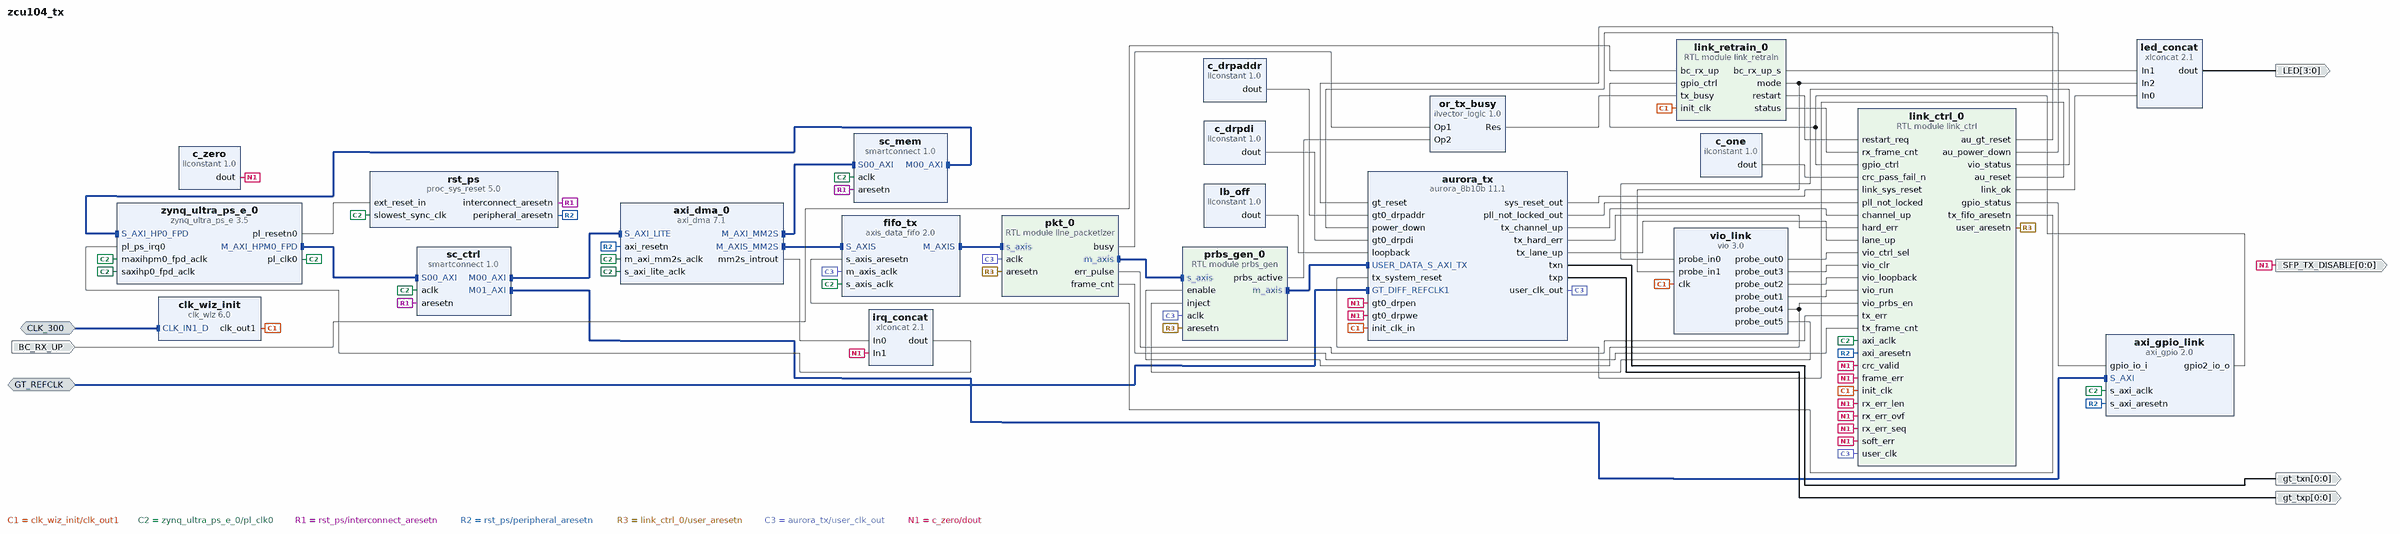
[diagram p0: block diagram of the top level]
# Vivado block design zcu104_tx, xczu7ev-ffvc1156-2-e, Vivado 2025.2
create_bd_design zcu104_tx

create_bd_intf_port -mode Slave -vlnv xilinx.com:interface:diff_clock_rtl:1.0 CLK_300
set_property -dict {CONFIG.FREQ_HZ 300000000} [get_bd_intf_ports CLK_300]
create_bd_intf_port -mode Slave -vlnv xilinx.com:interface:diff_clock_rtl:1.0 GT_REFCLK
set_property -dict {CONFIG.FREQ_HZ 125000000} [get_bd_intf_ports GT_REFCLK]
create_bd_port -dir O -from 0 -to 0 gt_txp
create_bd_port -dir O -from 0 -to 0 gt_txn
create_bd_port -dir O -from 0 -to 0 SFP_TX_DISABLE
create_bd_port -dir O -from 3 -to 0 LED
create_bd_port -dir I BC_RX_UP

create_bd_cell -type ip -vlnv xilinx.com:ip:zynq_ultra_ps_e:3.5 zynq_ultra_ps_e_0
set_property -dict [list \
  CONFIG.PSU_BANK_0_IO_STANDARD LVCMOS18 \
  CONFIG.PSU_BANK_1_IO_STANDARD LVCMOS18 \
  CONFIG.PSU_BANK_2_IO_STANDARD LVCMOS18 \
  CONFIG.PSU_USB3__DUAL_CLOCK_ENABLE 1 \
  CONFIG.PSU__CAN1__PERIPHERAL__ENABLE 1 \
  CONFIG.PSU__CAN1__PERIPHERAL__IO {MIO 24 .. 25} \
  CONFIG.PSU__CRF_APB__ACPU_CTRL__FREQMHZ 1200 \
  CONFIG.PSU__CRF_APB__ACPU_CTRL__SRCSEL APLL \
  CONFIG.PSU__CRF_APB__APLL_CTRL__SRCSEL PSS_REF_CLK \
  CONFIG.PSU__CRF_APB__DBG_FPD_CTRL__FREQMHZ 250 \
  CONFIG.PSU__CRF_APB__DBG_FPD_CTRL__SRCSEL IOPLL \
  CONFIG.PSU__CRF_APB__DBG_TRACE_CTRL__FREQMHZ 250 \
  CONFIG.PSU__CRF_APB__DBG_TRACE_CTRL__SRCSEL IOPLL \
  CONFIG.PSU__CRF_APB__DBG_TSTMP_CTRL__FREQMHZ 250 \
  CONFIG.PSU__CRF_APB__DBG_TSTMP_CTRL__SRCSEL IOPLL \
  CONFIG.PSU__CRF_APB__DDR_CTRL__FREQMHZ 1067 \
  CONFIG.PSU__CRF_APB__DDR_CTRL__SRCSEL DPLL \
  CONFIG.PSU__CRF_APB__DPDMA_REF_CTRL__FREQMHZ 600 \
  CONFIG.PSU__CRF_APB__DPDMA_REF_CTRL__SRCSEL APLL \
  CONFIG.PSU__CRF_APB__DPLL_CTRL__SRCSEL PSS_REF_CLK \
  CONFIG.PSU__CRF_APB__DP_AUDIO_REF_CTRL__SRCSEL RPLL \
  CONFIG.PSU__CRF_APB__DP_STC_REF_CTRL__SRCSEL RPLL \
  CONFIG.PSU__CRF_APB__DP_VIDEO_REF_CTRL__SRCSEL VPLL \
  CONFIG.PSU__CRF_APB__GDMA_REF_CTRL__FREQMHZ 600 \
  CONFIG.PSU__CRF_APB__GDMA_REF_CTRL__SRCSEL APLL \
  CONFIG.PSU__CRF_APB__GPU_REF_CTRL__FREQMHZ 500 \
  CONFIG.PSU__CRF_APB__GPU_REF_CTRL__SRCSEL IOPLL \
  CONFIG.PSU__CRF_APB__TOPSW_LSBUS_CTRL__FREQMHZ 100 \
  CONFIG.PSU__CRF_APB__TOPSW_LSBUS_CTRL__SRCSEL IOPLL \
  CONFIG.PSU__CRF_APB__TOPSW_MAIN_CTRL__FREQMHZ 533.33 \
  CONFIG.PSU__CRF_APB__TOPSW_MAIN_CTRL__SRCSEL DPLL \
  CONFIG.PSU__CRF_APB__VPLL_CTRL__SRCSEL PSS_REF_CLK \
  CONFIG.PSU__CRL_APB__ADMA_REF_CTRL__FREQMHZ 500 \
  CONFIG.PSU__CRL_APB__ADMA_REF_CTRL__SRCSEL IOPLL \
  CONFIG.PSU__CRL_APB__CAN1_REF_CTRL__FREQMHZ 100 \
  CONFIG.PSU__CRL_APB__CAN1_REF_CTRL__SRCSEL IOPLL \
  CONFIG.PSU__CRL_APB__CPU_R5_CTRL__FREQMHZ 500 \
  CONFIG.PSU__CRL_APB__CPU_R5_CTRL__SRCSEL IOPLL \
  CONFIG.PSU__CRL_APB__DBG_LPD_CTRL__FREQMHZ 250 \
  CONFIG.PSU__CRL_APB__DBG_LPD_CTRL__SRCSEL IOPLL \
  CONFIG.PSU__CRL_APB__GEM3_REF_CTRL__FREQMHZ 125 \
  CONFIG.PSU__CRL_APB__GEM3_REF_CTRL__SRCSEL IOPLL \
  CONFIG.PSU__CRL_APB__I2C0_REF_CTRL__FREQMHZ 100 \
  CONFIG.PSU__CRL_APB__I2C0_REF_CTRL__SRCSEL IOPLL \
  CONFIG.PSU__CRL_APB__I2C1_REF_CTRL__FREQMHZ 100 \
  CONFIG.PSU__CRL_APB__I2C1_REF_CTRL__SRCSEL IOPLL \
  CONFIG.PSU__CRL_APB__IOPLL_CTRL__SRCSEL PSS_REF_CLK \
  CONFIG.PSU__CRL_APB__IOU_SWITCH_CTRL__FREQMHZ 250 \
  CONFIG.PSU__CRL_APB__IOU_SWITCH_CTRL__SRCSEL IOPLL \
  CONFIG.PSU__CRL_APB__LPD_LSBUS_CTRL__FREQMHZ 100 \
  CONFIG.PSU__CRL_APB__LPD_LSBUS_CTRL__SRCSEL IOPLL \
  CONFIG.PSU__CRL_APB__LPD_SWITCH_CTRL__FREQMHZ 500 \
  CONFIG.PSU__CRL_APB__LPD_SWITCH_CTRL__SRCSEL IOPLL \
  CONFIG.PSU__CRL_APB__PCAP_CTRL__FREQMHZ 200 \
  CONFIG.PSU__CRL_APB__PCAP_CTRL__SRCSEL IOPLL \
  CONFIG.PSU__CRL_APB__PL0_REF_CTRL__FREQMHZ 100 \
  CONFIG.PSU__CRL_APB__PL0_REF_CTRL__SRCSEL IOPLL \
  CONFIG.PSU__CRL_APB__QSPI_REF_CTRL__FREQMHZ 125 \
  CONFIG.PSU__CRL_APB__QSPI_REF_CTRL__SRCSEL IOPLL \
  CONFIG.PSU__CRL_APB__RPLL_CTRL__SRCSEL PSS_REF_CLK \
  CONFIG.PSU__CRL_APB__SDIO1_REF_CTRL__FREQMHZ 200 \
  CONFIG.PSU__CRL_APB__SDIO1_REF_CTRL__SRCSEL IOPLL \
  CONFIG.PSU__CRL_APB__TIMESTAMP_REF_CTRL__FREQMHZ 100 \
  CONFIG.PSU__CRL_APB__TIMESTAMP_REF_CTRL__SRCSEL IOPLL \
  CONFIG.PSU__CRL_APB__UART0_REF_CTRL__FREQMHZ 100 \
  CONFIG.PSU__CRL_APB__UART0_REF_CTRL__SRCSEL IOPLL \
  CONFIG.PSU__CRL_APB__UART1_REF_CTRL__FREQMHZ 100 \
  CONFIG.PSU__CRL_APB__UART1_REF_CTRL__SRCSEL IOPLL \
  CONFIG.PSU__CRL_APB__USB0_BUS_REF_CTRL__FREQMHZ 250 \
  CONFIG.PSU__CRL_APB__USB0_BUS_REF_CTRL__SRCSEL IOPLL \
  CONFIG.PSU__CRL_APB__USB3_DUAL_REF_CTRL__FREQMHZ 20 \
  CONFIG.PSU__CRL_APB__USB3_DUAL_REF_CTRL__SRCSEL IOPLL \
  CONFIG.PSU__CRL_APB__USB3__ENABLE 1 \
  CONFIG.PSU__DDRC__BUS_WIDTH {64 Bit} \
  CONFIG.PSU__DDRC__COMPONENTS Components \
  CONFIG.PSU__DDRC__DEVICE_CAPACITY {4096 MBits} \
  CONFIG.PSU__DDRC__DRAM_WIDTH {16 Bits} \
  CONFIG.PSU__DDRC__ECC Disabled \
  CONFIG.PSU__DDRC__MEMORY_TYPE {DDR 4} \
  CONFIG.PSU__DDRC__SPEED_BIN DDR4_2133P \
  CONFIG.PSU__DDR_HIGH_ADDRESS_GUI_ENABLE 0 \
  CONFIG.PSU__DDR__INTERFACE__FREQMHZ 533.500 \
  CONFIG.PSU__DISPLAYPORT__LANE0__ENABLE 1 \
  CONFIG.PSU__DISPLAYPORT__LANE0__IO {GT Lane1} \
  CONFIG.PSU__DISPLAYPORT__LANE1__ENABLE 1 \
  CONFIG.PSU__DISPLAYPORT__LANE1__IO {GT Lane0} \
  CONFIG.PSU__DISPLAYPORT__PERIPHERAL__ENABLE 1 \
  CONFIG.PSU__DLL__ISUSED 1 \
  CONFIG.PSU__DPAUX__PERIPHERAL__ENABLE 1 \
  CONFIG.PSU__DPAUX__PERIPHERAL__IO {MIO 27 .. 30} \
  CONFIG.PSU__DP__LANE_SEL {Dual Lower} \
  CONFIG.PSU__DP__REF_CLK_FREQ 27 \
  CONFIG.PSU__DP__REF_CLK_SEL {Ref Clk3} \
  CONFIG.PSU__ENET3__FIFO__ENABLE 0 \
  CONFIG.PSU__ENET3__GRP_MDIO__ENABLE 1 \
  CONFIG.PSU__ENET3__GRP_MDIO__IO {MIO 76 .. 77} \
  CONFIG.PSU__ENET3__PERIPHERAL__ENABLE 1 \
  CONFIG.PSU__ENET3__PERIPHERAL__IO {MIO 64 .. 75} \
  CONFIG.PSU__ENET3__PTP__ENABLE 0 \
  CONFIG.PSU__ENET3__TSU__ENABLE 0 \
  CONFIG.PSU__FPGA_PL0_ENABLE 1 \
  CONFIG.PSU__GEM3_COHERENCY 0 \
  CONFIG.PSU__GEM3_ROUTE_THROUGH_FPD 0 \
  CONFIG.PSU__GEM__TSU__ENABLE 0 \
  CONFIG.PSU__GPIO0_MIO__PERIPHERAL__ENABLE 0 \
  CONFIG.PSU__GPIO1_MIO__PERIPHERAL__ENABLE 0 \
  CONFIG.PSU__GT__LINK_SPEED HBR \
  CONFIG.PSU__GT__PRE_EMPH_LVL_4 0 \
  CONFIG.PSU__GT__VLT_SWNG_LVL_4 0 \
  CONFIG.PSU__I2C0__PERIPHERAL__ENABLE 0 \
  CONFIG.PSU__I2C1__PERIPHERAL__ENABLE 1 \
  CONFIG.PSU__I2C1__PERIPHERAL__IO {MIO 16 .. 17} \
  CONFIG.PSU__IOU_SLCR__IOU_TTC_APB_CLK__TTC0_SEL APB \
  CONFIG.PSU__IOU_SLCR__IOU_TTC_APB_CLK__TTC1_SEL APB \
  CONFIG.PSU__IOU_SLCR__IOU_TTC_APB_CLK__TTC2_SEL APB \
  CONFIG.PSU__IOU_SLCR__IOU_TTC_APB_CLK__TTC3_SEL APB \
  CONFIG.PSU__MAXIGP0__DATA_WIDTH 128 \
  CONFIG.PSU__OVERRIDE__BASIC_CLOCK 0 \
  CONFIG.PSU__PRESET_APPLIED 1 \
  CONFIG.PSU__PSS_REF_CLK__FREQMHZ 33.333333 \
  CONFIG.PSU__QSPI_COHERENCY 0 \
  CONFIG.PSU__QSPI_ROUTE_THROUGH_FPD 0 \
  CONFIG.PSU__QSPI__GRP_FBCLK__ENABLE 1 \
  CONFIG.PSU__QSPI__GRP_FBCLK__IO {MIO 6} \
  CONFIG.PSU__QSPI__PERIPHERAL__DATA_MODE x4 \
  CONFIG.PSU__QSPI__PERIPHERAL__ENABLE 1 \
  CONFIG.PSU__QSPI__PERIPHERAL__IO {MIO 0 .. 5} \
  CONFIG.PSU__QSPI__PERIPHERAL__MODE Single \
  CONFIG.PSU__SATA__LANE1__IO {GT Lane3} \
  CONFIG.PSU__SATA__PERIPHERAL__ENABLE 1 \
  CONFIG.PSU__SATA__REF_CLK_FREQ 125 \
  CONFIG.PSU__SATA__REF_CLK_SEL {Ref Clk1} \
  CONFIG.PSU__SD1_COHERENCY 0 \
  CONFIG.PSU__SD1_ROUTE_THROUGH_FPD 0 \
  CONFIG.PSU__SD1__CLK_50_SDR_ITAP_DLY 0x15 \
  CONFIG.PSU__SD1__CLK_50_SDR_OTAP_DLY 0x5 \
  CONFIG.PSU__SD1__DATA_TRANSFER_MODE 4Bit \
  CONFIG.PSU__SD1__GRP_CD__ENABLE 1 \
  CONFIG.PSU__SD1__GRP_CD__IO {MIO 45} \
  CONFIG.PSU__SD1__GRP_POW__ENABLE 0 \
  CONFIG.PSU__SD1__GRP_WP__ENABLE 0 \
  CONFIG.PSU__SD1__PERIPHERAL__ENABLE 1 \
  CONFIG.PSU__SD1__PERIPHERAL__IO {MIO 46 .. 51} \
  CONFIG.PSU__SD1__SLOT_TYPE {SD 2.0} \
  CONFIG.PSU__SWDT0__CLOCK__ENABLE 0 \
  CONFIG.PSU__SWDT0__PERIPHERAL__ENABLE 1 \
  CONFIG.PSU__SWDT0__RESET__ENABLE 0 \
  CONFIG.PSU__SWDT1__CLOCK__ENABLE 0 \
  CONFIG.PSU__SWDT1__PERIPHERAL__ENABLE 1 \
  CONFIG.PSU__SWDT1__RESET__ENABLE 0 \
  CONFIG.PSU__TSU__BUFG_PORT_PAIR 0 \
  CONFIG.PSU__TTC0__CLOCK__ENABLE 0 \
  CONFIG.PSU__TTC0__PERIPHERAL__ENABLE 1 \
  CONFIG.PSU__TTC0__WAVEOUT__ENABLE 0 \
  CONFIG.PSU__TTC1__CLOCK__ENABLE 0 \
  CONFIG.PSU__TTC1__PERIPHERAL__ENABLE 1 \
  CONFIG.PSU__TTC1__WAVEOUT__ENABLE 0 \
  CONFIG.PSU__TTC2__CLOCK__ENABLE 0 \
  CONFIG.PSU__TTC2__PERIPHERAL__ENABLE 1 \
  CONFIG.PSU__TTC2__WAVEOUT__ENABLE 0 \
  CONFIG.PSU__TTC3__CLOCK__ENABLE 0 \
  CONFIG.PSU__TTC3__PERIPHERAL__ENABLE 1 \
  CONFIG.PSU__TTC3__WAVEOUT__ENABLE 0 \
  CONFIG.PSU__UART0__BAUD_RATE 115200 \
  CONFIG.PSU__UART0__MODEM__ENABLE 0 \
  CONFIG.PSU__UART0__PERIPHERAL__ENABLE 1 \
  CONFIG.PSU__UART0__PERIPHERAL__IO {MIO 18 .. 19} \
  CONFIG.PSU__UART1__BAUD_RATE 115200 \
  CONFIG.PSU__UART1__MODEM__ENABLE 0 \
  CONFIG.PSU__UART1__PERIPHERAL__ENABLE 1 \
  CONFIG.PSU__UART1__PERIPHERAL__IO {MIO 20 .. 21} \
  CONFIG.PSU__USB0_COHERENCY 0 \
  CONFIG.PSU__USB0__PERIPHERAL__ENABLE 1 \
  CONFIG.PSU__USB0__PERIPHERAL__IO {MIO 52 .. 63} \
  CONFIG.PSU__USB0__REF_CLK_FREQ 26 \
  CONFIG.PSU__USB0__REF_CLK_SEL {Ref Clk2} \
  CONFIG.PSU__USB2_0__EMIO__ENABLE 0 \
  CONFIG.PSU__USB3_0__EMIO__ENABLE 0 \
  CONFIG.PSU__USB3_0__PERIPHERAL__ENABLE 1 \
  CONFIG.PSU__USB3_0__PERIPHERAL__IO {GT Lane2} \
  CONFIG.PSU__USB__RESET__MODE {Boot Pin} \
  CONFIG.PSU__USB__RESET__POLARITY {Active Low} \
  CONFIG.PSU__USE__IRQ0 1 \
  CONFIG.PSU__USE__M_AXI_GP0 1 \
  CONFIG.PSU__USE__M_AXI_GP1 0 \
  CONFIG.PSU__USE__M_AXI_GP2 0 \
  CONFIG.PSU__USE__S_AXI_GP2 1 \
] [get_bd_cells zynq_ultra_ps_e_0]
# 87 more settings of zynq_ultra_ps_e_0 are not shown: defaults, MIO pin electricals, DDR timing, and values the tool derives
create_bd_cell -type ip -vlnv xilinx.com:ip:proc_sys_reset:5.0 rst_ps
create_bd_cell -type ip -vlnv xilinx.com:ip:axi_dma:7.1 axi_dma_0
set_property -dict [list \
  CONFIG.c_addr_width 32 \
  CONFIG.c_include_mm2s 1 \
  CONFIG.c_include_s2mm 0 \
  CONFIG.c_include_sg 0 \
  CONFIG.c_m_axi_mm2s_data_width 64 \
  CONFIG.c_m_axis_mm2s_tdata_width 32 \
  CONFIG.c_mm2s_burst_size 64 \
  CONFIG.c_sg_length_width 24 \
] [get_bd_cells axi_dma_0]
create_bd_cell -type ip -vlnv xilinx.com:ip:axi_gpio:2.0 axi_gpio_link
set_property -dict [list \
  CONFIG.C_ALL_INPUTS 1 \
  CONFIG.C_ALL_OUTPUTS_2 1 \
  CONFIG.C_DOUT_DEFAULT_2 0x00000001 \
  CONFIG.C_GPIO2_WIDTH 32 \
  CONFIG.C_GPIO_WIDTH 32 \
  CONFIG.C_IS_DUAL 1 \
] [get_bd_cells axi_gpio_link]
create_bd_cell -type ip -vlnv xilinx.com:ip:smartconnect:1.0 sc_ctrl
set_property -dict {CONFIG.NUM_MI 2 CONFIG.NUM_SI 1} [get_bd_cells sc_ctrl]
create_bd_cell -type ip -vlnv xilinx.com:ip:smartconnect:1.0 sc_mem
set_property -dict {CONFIG.NUM_MI 1 CONFIG.NUM_SI 1} [get_bd_cells sc_mem]
create_bd_cell -type ip -vlnv xilinx.com:ip:xlconcat:2.1 irq_concat
set_property -dict {CONFIG.NUM_PORTS 2} [get_bd_cells irq_concat]
create_bd_cell -type ip -vlnv xilinx.com:ip:axis_data_fifo:2.0 fifo_tx
set_property -dict {CONFIG.FIFO_DEPTH 1024 CONFIG.IS_ACLK_ASYNC 1} [get_bd_cells fifo_tx]
create_bd_cell -type module -reference line_packetizer pkt_0
set_property -dict {CONFIG.FMT 0 CONFIG.H_BEATS 640 CONFIG.V_LINES 720} [get_bd_cells pkt_0]
create_bd_cell -type module -reference prbs_gen prbs_gen_0
set_property -dict {CONFIG.FRAME_WORDS 256} [get_bd_cells prbs_gen_0]
create_bd_cell -type module -reference link_ctrl link_ctrl_0
set_property -dict {CONFIG.EMULATED 0 CONFIG.RXC_INIT 1} [get_bd_cells link_ctrl_0]
create_bd_cell -type module -reference link_retrain link_retrain_0
set_property -dict [list \
  CONFIG.BC_DEB_US 20 \
  CONFIG.BC_DOWN_MS 100 \
  CONFIG.BC_PRESENT 1 \
  CONFIG.CLK_HZ 62500000 \
  CONFIG.HOLDOFF_MS 500 \
  CONFIG.IDLE_US 100 \
  CONFIG.PERIOD_MS 1000 \
] [get_bd_cells link_retrain_0]
create_bd_cell -type ip -vlnv xilinx.com:ip:vio:3.0 vio_link
set_property -dict [list \
  CONFIG.C_EN_PROBE_IN_ACTIVITY 0 \
  CONFIG.C_NUM_PROBE_IN 2 \
  CONFIG.C_NUM_PROBE_OUT 6 \
  CONFIG.C_PROBE_IN0_WIDTH 32 \
  CONFIG.C_PROBE_IN1_WIDTH 2 \
  CONFIG.C_PROBE_OUT0_INIT_VAL 0x1 \
  CONFIG.C_PROBE_OUT0_WIDTH 1 \
  CONFIG.C_PROBE_OUT1_INIT_VAL 0x1 \
  CONFIG.C_PROBE_OUT1_WIDTH 1 \
  CONFIG.C_PROBE_OUT2_INIT_VAL 0x0 \
  CONFIG.C_PROBE_OUT2_WIDTH 3 \
  CONFIG.C_PROBE_OUT3_INIT_VAL 0x0 \
  CONFIG.C_PROBE_OUT3_WIDTH 1 \
  CONFIG.C_PROBE_OUT4_INIT_VAL 0x0 \
  CONFIG.C_PROBE_OUT4_WIDTH 1 \
  CONFIG.C_PROBE_OUT5_INIT_VAL 0x0 \
  CONFIG.C_PROBE_OUT5_WIDTH 1 \
] [get_bd_cells vio_link]
create_bd_cell -type inline_hdl -vlnv xilinx.com:inline_hdl:ilvector_logic:1.0 or_tx_busy
set_property -dict {CONFIG.C_OPERATION or CONFIG.C_SIZE 1} [get_bd_cells or_tx_busy]
create_bd_cell -type ip -vlnv xilinx.com:ip:xlconcat:2.1 led_concat
set_property -dict {CONFIG.IN2_WIDTH 2 CONFIG.NUM_PORTS 3} [get_bd_cells led_concat]
create_bd_cell -type ip -vlnv xilinx.com:ip:aurora_8b10b:11.1 aurora_tx
set_property -dict [list \
  CONFIG.Backchannel_mode Timer \
  CONFIG.C_AURORA_LANES 1 \
  CONFIG.C_DRP_IF true \
  CONFIG.C_LANE_WIDTH 4 \
  CONFIG.C_LINE_RATE 3.125 \
  CONFIG.C_REFCLK_FREQUENCY 125 \
  CONFIG.C_REFCLK_SOURCE {MGTREFCLK0 of Quad X0Y3} \
  CONFIG.C_START_LANE X0Y15 \
  CONFIG.C_START_QUAD Quad_X0Y3 \
  CONFIG.C_USE_BYTESWAP true \
  CONFIG.C_USE_CRC true \
  CONFIG.C_USE_SCRAMBLER false \
  CONFIG.Dataflow_Config TX-only_Simplex \
  CONFIG.Flow_Mode None \
  CONFIG.Interface_Mode Framing \
  CONFIG.SupportLevel 1 \
  CONFIG.TransceiverControl false \
] [get_bd_cells aurora_tx]
create_bd_cell -type ip -vlnv xilinx.com:ip:clk_wiz:6.0 clk_wiz_init
set_property -dict [list \
  CONFIG.CLKOUT1_REQUESTED_OUT_FREQ 62.5 \
  CONFIG.PRIM_IN_FREQ 300.000 \
  CONFIG.PRIM_SOURCE Differential_clock_capable_pin \
  CONFIG.USE_LOCKED false \
  CONFIG.USE_RESET false \
] [get_bd_cells clk_wiz_init]
create_bd_cell -type inline_hdl -vlnv xilinx.com:inline_hdl:ilconstant:1.0 c_zero
set_property -dict {CONFIG.CONST_VAL 0 CONFIG.CONST_WIDTH 1} [get_bd_cells c_zero]
create_bd_cell -type inline_hdl -vlnv xilinx.com:inline_hdl:ilconstant:1.0 c_one
set_property -dict {CONFIG.CONST_VAL 1 CONFIG.CONST_WIDTH 1} [get_bd_cells c_one]
create_bd_cell -type inline_hdl -vlnv xilinx.com:inline_hdl:ilconstant:1.0 lb_off
set_property -dict {CONFIG.CONST_VAL 0 CONFIG.CONST_WIDTH 3} [get_bd_cells lb_off]
create_bd_cell -type inline_hdl -vlnv xilinx.com:inline_hdl:ilconstant:1.0 c_drpaddr
set_property -dict {CONFIG.CONST_VAL 0 CONFIG.CONST_WIDTH 10} [get_bd_cells c_drpaddr]
create_bd_cell -type inline_hdl -vlnv xilinx.com:inline_hdl:ilconstant:1.0 c_drpdi
set_property -dict {CONFIG.CONST_VAL 0 CONFIG.CONST_WIDTH 16} [get_bd_cells c_drpdi]

# ---- connections ----

connect_bd_intf_net -intf_net CLK_300_1 [get_bd_intf_ports CLK_300] [get_bd_intf_pins clk_wiz_init/CLK_IN1_D]
connect_bd_intf_net [get_bd_intf_ports GT_REFCLK] [get_bd_intf_pins aurora_tx/GT_DIFF_REFCLK1]
connect_bd_intf_net -intf_net dma_mm2s [get_bd_intf_pins axi_dma_0/M_AXI_MM2S] [get_bd_intf_pins sc_mem/S00_AXI]
connect_bd_intf_net -intf_net dma_mm2s_axis [get_bd_intf_pins axi_dma_0/M_AXIS_MM2S] [get_bd_intf_pins fifo_tx/S_AXIS]
connect_bd_intf_net -intf_net fifo_tx_m [get_bd_intf_pins fifo_tx/M_AXIS] [get_bd_intf_pins pkt_0/s_axis]
connect_bd_intf_net -intf_net hpm0_fpd [get_bd_intf_pins zynq_ultra_ps_e_0/M_AXI_HPM0_FPD] [get_bd_intf_pins sc_ctrl/S00_AXI]
connect_bd_intf_net -intf_net pkt_m [get_bd_intf_pins pkt_0/m_axis] [get_bd_intf_pins prbs_gen_0/s_axis]
connect_bd_intf_net -intf_net prbs_gen_m [get_bd_intf_pins prbs_gen_0/m_axis] [get_bd_intf_pins aurora_tx/USER_DATA_S_AXI_TX]
connect_bd_intf_net -intf_net sc_ctrl_M00 [get_bd_intf_pins sc_ctrl/M00_AXI] [get_bd_intf_pins axi_dma_0/S_AXI_LITE]
connect_bd_intf_net -intf_net sc_ctrl_M01 [get_bd_intf_pins sc_ctrl/M01_AXI] [get_bd_intf_pins axi_gpio_link/S_AXI]
connect_bd_intf_net -intf_net sc_mem_M00 [get_bd_intf_pins sc_mem/M00_AXI] [get_bd_intf_pins zynq_ultra_ps_e_0/S_AXI_HP0_FPD]
connect_bd_net -net au_sys_reset_out [get_bd_pins aurora_tx/sys_reset_out] [get_bd_pins link_ctrl_0/link_sys_reset]
connect_bd_net [get_bd_ports BC_RX_UP] [get_bd_pins link_retrain_0/bc_rx_up]
connect_bd_net -net bc_rx_up_s [get_bd_pins link_retrain_0/bc_rx_up_s] [get_bd_pins led_concat/In1]
connect_bd_net -net drpaddr_zero [get_bd_pins c_drpaddr/dout] [get_bd_pins aurora_tx/gt0_drpaddr]
connect_bd_net -net drpdi_zero [get_bd_pins c_drpdi/dout] [get_bd_pins aurora_tx/gt0_drpdi]
connect_bd_net -net gpio_ctrl [get_bd_pins axi_gpio_link/gpio2_io_o] [get_bd_pins link_ctrl_0/gpio_ctrl] [get_bd_pins link_retrain_0/gpio_ctrl]
connect_bd_net -net gpio_status [get_bd_pins link_ctrl_0/gpio_status] [get_bd_pins axi_gpio_link/gpio_io_i]
connect_bd_net -net gt_txn_1 [get_bd_pins aurora_tx/txn] [get_bd_ports gt_txn]
connect_bd_net -net gt_txp_1 [get_bd_pins aurora_tx/txp] [get_bd_ports gt_txp]
connect_bd_net -net init_clk [get_bd_pins clk_wiz_init/clk_out1] \
  [get_bd_pins aurora_tx/init_clk_in] [get_bd_pins link_ctrl_0/init_clk] [get_bd_pins link_retrain_0/init_clk] \
  [get_bd_pins vio_link/clk]
connect_bd_net -net irq_pl_ps [get_bd_pins irq_concat/dout] [get_bd_pins zynq_ultra_ps_e_0/pl_ps_irq0]
connect_bd_net [get_bd_pins lb_off/dout] [get_bd_pins aurora_tx/loopback]
connect_bd_net -net led [get_bd_pins led_concat/dout] [get_bd_ports LED]
connect_bd_net -net link_ctrl_au_gt_reset [get_bd_pins link_ctrl_0/au_gt_reset] [get_bd_pins aurora_tx/gt_reset]
connect_bd_net -net link_ctrl_au_power_down [get_bd_pins link_ctrl_0/au_power_down] [get_bd_pins aurora_tx/power_down]
connect_bd_net -net link_ctrl_au_reset [get_bd_pins link_ctrl_0/au_reset] [get_bd_pins aurora_tx/tx_system_reset]
connect_bd_net -net link_ok [get_bd_pins link_ctrl_0/link_ok] [get_bd_pins led_concat/In0]
connect_bd_net -net link_status [get_bd_pins link_ctrl_0/vio_status] [get_bd_pins vio_link/probe_in0]
connect_bd_net -net mm2s_introut [get_bd_pins axi_dma_0/mm2s_introut] [get_bd_pins irq_concat/In0]
connect_bd_net -net one [get_bd_pins c_one/dout] [get_bd_pins link_ctrl_0/crc_pass_fail_n]
connect_bd_net -net pkt_busy [get_bd_pins pkt_0/busy] [get_bd_pins or_tx_busy/Op1]
connect_bd_net -net pkt_err [get_bd_pins pkt_0/err_pulse] [get_bd_pins link_ctrl_0/tx_err]
connect_bd_net -net pkt_frame_cnt [get_bd_pins pkt_0/frame_cnt] [get_bd_pins link_ctrl_0/tx_frame_cnt]
connect_bd_net -net pl_clk0 [get_bd_pins zynq_ultra_ps_e_0/pl_clk0] \
  [get_bd_pins zynq_ultra_ps_e_0/maxihpm0_fpd_aclk] [get_bd_pins zynq_ultra_ps_e_0/saxihp0_fpd_aclk] \
  [get_bd_pins rst_ps/slowest_sync_clk] [get_bd_pins axi_dma_0/s_axi_lite_aclk] [get_bd_pins axi_dma_0/m_axi_mm2s_aclk] \
  [get_bd_pins axi_gpio_link/s_axi_aclk] [get_bd_pins sc_ctrl/aclk] [get_bd_pins sc_mem/aclk] \
  [get_bd_pins fifo_tx/s_axis_aclk] [get_bd_pins link_ctrl_0/axi_aclk]
connect_bd_net -net pl_resetn0 [get_bd_pins zynq_ultra_ps_e_0/pl_resetn0] [get_bd_pins rst_ps/ext_reset_in]
connect_bd_net -net pll_not_locked [get_bd_pins aurora_tx/pll_not_locked_out] [get_bd_pins link_ctrl_0/pll_not_locked]
connect_bd_net -net prbs_active [get_bd_pins prbs_gen_0/prbs_active] [get_bd_pins or_tx_busy/Op2]
connect_bd_net -net retrain_mode [get_bd_pins link_retrain_0/mode] [get_bd_pins vio_link/probe_in1] [get_bd_pins led_concat/In2]
connect_bd_net -net retrain_req [get_bd_pins link_retrain_0/restart] [get_bd_pins link_ctrl_0/restart_req]
connect_bd_net -net retrain_status [get_bd_pins link_retrain_0/status] [get_bd_pins link_ctrl_0/rx_frame_cnt]
connect_bd_net -net rst_ps_ic_aresetn [get_bd_pins rst_ps/interconnect_aresetn] [get_bd_pins sc_ctrl/aresetn] [get_bd_pins sc_mem/aresetn]
connect_bd_net -net rst_ps_periph_aresetn [get_bd_pins rst_ps/peripheral_aresetn] \
  [get_bd_pins axi_dma_0/axi_resetn] [get_bd_pins axi_gpio_link/s_axi_aresetn] [get_bd_pins link_ctrl_0/axi_aresetn]
connect_bd_net -net tx_busy [get_bd_pins or_tx_busy/Res] [get_bd_pins link_retrain_0/tx_busy]
connect_bd_net -net tx_channel_up [get_bd_pins aurora_tx/tx_channel_up] [get_bd_pins link_ctrl_0/channel_up]
connect_bd_net -net tx_fifo_aresetn [get_bd_pins link_ctrl_0/tx_fifo_aresetn] [get_bd_pins fifo_tx/s_axis_aresetn]
connect_bd_net -net tx_hard_err [get_bd_pins aurora_tx/tx_hard_err] [get_bd_pins link_ctrl_0/hard_err]
connect_bd_net -net tx_lane_up [get_bd_pins aurora_tx/tx_lane_up] [get_bd_pins link_ctrl_0/lane_up]
connect_bd_net -net user_aresetn [get_bd_pins link_ctrl_0/user_aresetn] [get_bd_pins pkt_0/aresetn] [get_bd_pins prbs_gen_0/aresetn]
connect_bd_net -net user_clk [get_bd_pins aurora_tx/user_clk_out] \
  [get_bd_pins fifo_tx/m_axis_aclk] [get_bd_pins pkt_0/aclk] [get_bd_pins prbs_gen_0/aclk] [get_bd_pins link_ctrl_0/user_clk]
connect_bd_net -net vio_ctrl_sel [get_bd_pins vio_link/probe_out0] [get_bd_pins link_ctrl_0/vio_ctrl_sel]
connect_bd_net -net vio_err_clear [get_bd_pins vio_link/probe_out3] [get_bd_pins link_ctrl_0/vio_clr]
connect_bd_net -net vio_loopback [get_bd_pins vio_link/probe_out2] [get_bd_pins link_ctrl_0/vio_loopback]
connect_bd_net -net vio_prbs_en [get_bd_pins vio_link/probe_out4] [get_bd_pins prbs_gen_0/enable] [get_bd_pins link_ctrl_0/vio_prbs_en]
connect_bd_net -net vio_prbs_inject [get_bd_pins vio_link/probe_out5] [get_bd_pins prbs_gen_0/inject]
connect_bd_net -net vio_run [get_bd_pins vio_link/probe_out1] [get_bd_pins link_ctrl_0/vio_run]
connect_bd_net -net zero [get_bd_pins c_zero/dout] \
  [get_bd_pins link_ctrl_0/soft_err] [get_bd_pins link_ctrl_0/frame_err] [get_bd_pins link_ctrl_0/crc_valid] \
  [get_bd_pins link_ctrl_0/rx_err_seq] [get_bd_pins link_ctrl_0/rx_err_len] [get_bd_pins link_ctrl_0/rx_err_ovf] \
  [get_bd_pins irq_concat/In1] [get_bd_ports SFP_TX_DISABLE] [get_bd_pins aurora_tx/gt0_drpen] \
  [get_bd_pins aurora_tx/gt0_drpwe]

# ---- address map ----
assign_bd_address -offset 0x00000000 -range 2G -target_address_space [get_bd_addr_spaces axi_dma_0/Data_MM2S] [get_bd_addr_segs zynq_ultra_ps_e_0/SAXIGP2/HP0_DDR_LOW]
assign_bd_address -offset 0x00A0000000 -range 64K -target_address_space [get_bd_addr_spaces zynq_ultra_ps_e_0/Data] [get_bd_addr_segs axi_dma_0/S_AXI_LITE/Reg]
assign_bd_address -offset 0x00A0010000 -range 64K -target_address_space [get_bd_addr_spaces zynq_ultra_ps_e_0/Data] [get_bd_addr_segs axi_gpio_link/S_AXI/Reg]

validate_bd_design
save_bd_design
